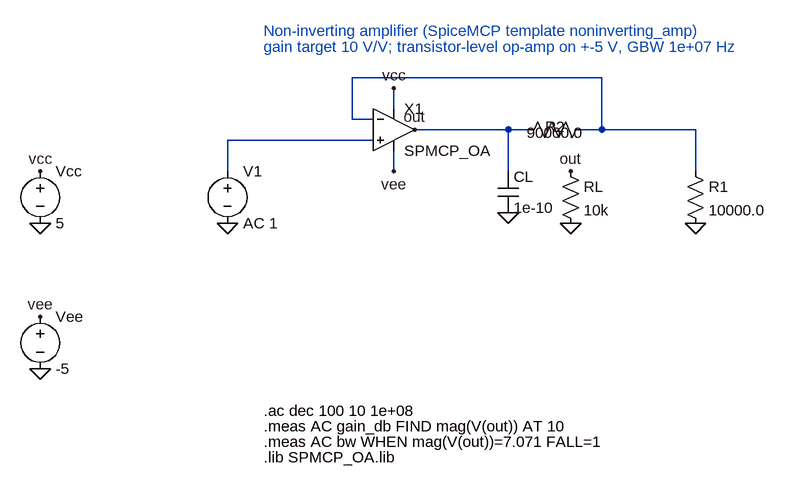
[diagram p0: schematic noninverting_amp.asc]
noninverting_amp.asc, the LTspice schematic file:
Version 4.1
SHEET 1 1600 1200
WIRE 160 16 -64 16
WIRE -64 16 -64 64
WIRE 400 0 368 0
WIRE 368 0 224 0
WIRE 368 64 368 0
WIRE 480 0 512 0
WIRE 512 0 512 -80
WIRE 512 -80 128 -80
WIRE 128 -80 128 -16
WIRE 128 -16 160 -16
WIRE 656 64 656 0
WIRE 656 0 512 0
WIRE 192 -32 192 -64
WIRE 192 32 192 64
FLAG 464 64 out
FLAG 224 0 out
FLAG -352 64 vcc
FLAG -352 288 vee
FLAG 192 -64 vcc
FLAG 192 64 vee
FLAG -64 144 0
FLAG -352 144 0
FLAG -352 368 0
FLAG 656 144 0
FLAG 464 144 0
FLAG 368 128 0
SYMBOL OpAmps\\opamp2 192 -64 R0
SYMATTR InstName X1
SYMATTR Value SPMCP_OA
SYMBOL res 384 16 R270
WINDOW 0 36 56 VBottom 2
WINDOW 3 -4 56 VTop 2
SYMATTR InstName R2
SYMATTR Value 90000.0
SYMBOL cap 352 64 R0
SYMATTR InstName CL
SYMATTR Value 1e-10
SYMBOL res 640 48 R0
SYMATTR InstName R1
SYMATTR Value 10000.0
SYMBOL res 448 48 R0
SYMATTR InstName RL
SYMATTR Value 10k
SYMBOL voltage -64 48 R0
SYMATTR InstName V1
SYMATTR Value AC 1
SYMBOL voltage -352 48 R0
SYMATTR InstName Vcc
SYMATTR Value 5
SYMBOL voltage -352 272 R0
SYMATTR InstName Vee
SYMATTR Value -5
TEXT -8 -152 Left 2 ;Non-inverting amplifier (SpiceMCP template noninverting_amp)
TEXT -8 -128 Left 2 ;gain target 10 V/V; transistor-level op-amp on +-5 V, GBW 1e+07 Hz
TEXT -8 432 Left 2 !.ac dec 100 10 1e+08
TEXT -8 456 Left 2 !.meas AC gain_db FIND mag(V(out)) AT 10
TEXT -8 480 Left 2 !.meas AC bw WHEN mag(V(out))=7.071 FALL=1
TEXT -8 504 Left 2 !.lib SPMCP_OA.lib

The netlist it stands for:
* noninverting_amp.asc
X§X1 N001 N002 vcc vee out SPMCP_OA  ; pins In+ In- V+ V- OUT
R2 out N002 90000.0
CL out 0 1e-10
R1 N002 0 10000.0
RL out 0 10k
V1 N001 0 AC 1
Vcc vcc 0 5
Vee vee 0 -5
* Non-inverting amplifier (SpiceMCP template noninverting_amp)
* gain target 10 V/V; transistor-level op-amp on +-5 V, GBW 1e+07 Hz
.ac dec 100 10 1e+08
.meas AC gain_db FIND mag(V(out)) AT 10
.meas AC bw WHEN mag(V(out))=7.071 FALL=1
.lib SPMCP_OA.lib
.backanno
.end